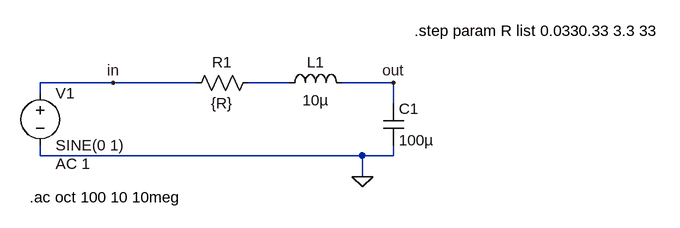
[diagram p0: schematic lc_filter_damping_series.asc]
lc_filter_damping_series.asc, the LTspice schematic file:
Version 4
SHEET 1 880 680
WIRE -128 144 -240 144
WIRE 0 144 -128 144
WIRE 144 144 80 144
WIRE 304 144 224 144
WIRE -240 160 -240 144
WIRE 304 176 304 144
WIRE -240 256 -240 240
WIRE 256 256 -240 256
WIRE 304 256 304 240
WIRE 304 256 256 256
WIRE 256 288 256 256
FLAG 256 288 0
FLAG 304 144 out
FLAG -128 144 in
SYMBOL ind 128 160 R270
WINDOW 0 32 56 VTop 2
WINDOW 3 5 56 VBottom 2
SYMATTR InstName L1
SYMATTR Value 10µ
SYMBOL cap 288 176 R0
SYMATTR InstName C1
SYMATTR Value 100µ
SYMBOL voltage -240 144 R0
WINDOW 123 24 124 Left 2
WINDOW 39 0 0 Left 0
SYMATTR Value2 AC 1
SYMATTR InstName V1
SYMATTR Value SINE(0 1)
SYMBOL res 96 128 R90
WINDOW 0 0 56 VBottom 2
WINDOW 3 32 56 VTop 2
SYMATTR InstName R1
SYMATTR Value {R}
TEXT -256 320 Left 2 !.ac oct 100 10 10meg
TEXT 336 64 Left 2 !.step param R list 0.0330.33 3.3 33

The netlist it stands for:
* lc_filter_damping_series.asc
L1 N001 out 10µ
C1 out 0 100µ
V1 in 0 SINE(0 1) AC 1
R1 N001 in {R}
.ac oct 100 10 10meg
.step param R list 0.0330.33 3.3 33
.backanno
.end